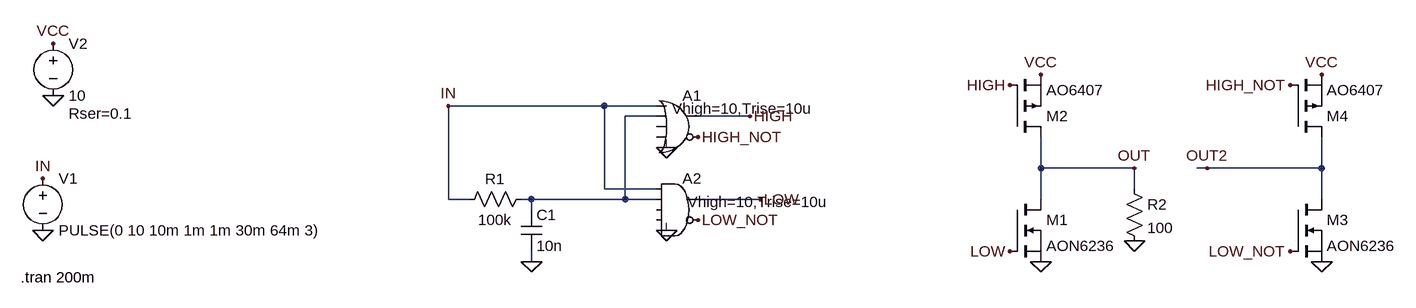
[diagram p0: schematic bridge_driver.asc]
bridge_driver.asc, the LTspice schematic file:
Version 4
SHEET 1 1752 680
WIRE 528 96 288 96
WIRE 608 96 528 96
WIRE 608 112 560 112
WIRE 752 112 672 112
WIRE 1200 192 1200 144
WIRE 1344 192 1200 192
WIRE 1456 192 1440 192
WIRE 1632 192 1632 144
WIRE 1632 192 1456 192
WIRE 528 224 528 96
WIRE 608 224 528 224
WIRE 1344 224 1344 192
WIRE 288 240 288 96
WIRE 320 240 288 240
WIRE 416 240 400 240
WIRE 560 240 560 112
WIRE 560 240 416 240
WIRE 608 240 560 240
WIRE 768 240 672 240
WIRE 1200 240 1200 192
WIRE 1632 240 1632 192
WIRE 416 256 416 240
WIRE 416 336 416 320
FLAG -320 80 0
FLAG -320 0 VCC
FLAG -336 208 IN
FLAG -336 288 0
FLAG 624 288 0
FLAG 624 160 0
FLAG 416 336 0
FLAG 288 96 IN
FLAG 752 112 HIGH
FLAG 768 240 LOW
FLAG 1200 48 VCC
FLAG 1200 336 0
FLAG 1152 64 HIGH
FLAG 1152 320 LOW
FLAG 1344 192 OUT
FLAG 1632 48 VCC
FLAG 1632 336 0
FLAG 1584 320 LOW_NOT
FLAG 1584 64 HIGH_NOT
FLAG 1456 192 OUT2
FLAG 672 144 HIGH_NOT
FLAG 672 272 LOW_NOT
FLAG 1344 304 0
SYMBOL Digital\\or 640 64 R0
WINDOW 3 -8 36 Left 2
SYMATTR InstName A1
SYMATTR Value Vhigh=10,Trise=10u
SYMBOL Digital\\and 640 192 R0
WINDOW 3 16 52 Left 2
SYMATTR InstName A2
SYMATTR Value Vhigh=10,Trise=10u
SYMBOL voltage -336 192 R0
WINDOW 123 0 0 Left 0
WINDOW 39 0 0 Left 0
SYMATTR InstName V1
SYMATTR Value PULSE(0 10 10m 1m 1m 30m 64m 3)
SYMBOL voltage -320 -16 R0
WINDOW 123 0 0 Left 0
WINDOW 39 24 124 Left 2
SYMATTR InstName V2
SYMATTR Value 10
SYMATTR SpiceLine Rser=0.1
SYMBOL res 416 224 R90
WINDOW 0 0 56 VBottom 2
WINDOW 3 32 56 VTop 2
SYMATTR InstName R1
SYMATTR Value 100k
SYMBOL cap 400 256 R0
SYMATTR InstName C1
SYMATTR Value 10n
SYMBOL nmos 1152 240 R0
SYMATTR InstName M1
SYMATTR Value AON6236
SYMBOL res 1328 208 R0
SYMATTR InstName R2
SYMATTR Value 100
SYMBOL nmos 1584 240 R0
SYMATTR InstName M3
SYMATTR Value AON6236
SYMBOL pmos 1152 144 M180
SYMATTR InstName M2
SYMATTR Value AO6407
SYMBOL pmos 1584 144 M180
SYMATTR InstName M4
SYMATTR Value AO6407
TEXT -370 360 Left 2 !.tran 200m

The netlist it stands for:
* bridge_driver.asc
A1 IN N001 0 0 0 HIGH_NOT HIGH 0 OR Vhigh=10,Trise=10u
A2 IN N001 0 0 0 LOW_NOT LOW 0 AND Vhigh=10,Trise=10u
V1 IN 0 PULSE(0 10 10m 1m 1m 30m 64m 3)
V2 VCC 0 10 Rser=0.1
R1 N001 IN 100k
C1 N001 0 10n
M1 OUT LOW 0 0 AON6236
R2 OUT 0 100
M3 OUT2 LOW_NOT 0 0 AON6236
M2 OUT HIGH VCC VCC AO6407
M4 OUT2 HIGH_NOT VCC VCC AO6407
.model NMOS NMOS
.model PMOS PMOS
.lib standard.mos
.tran 200m
.backanno
.end